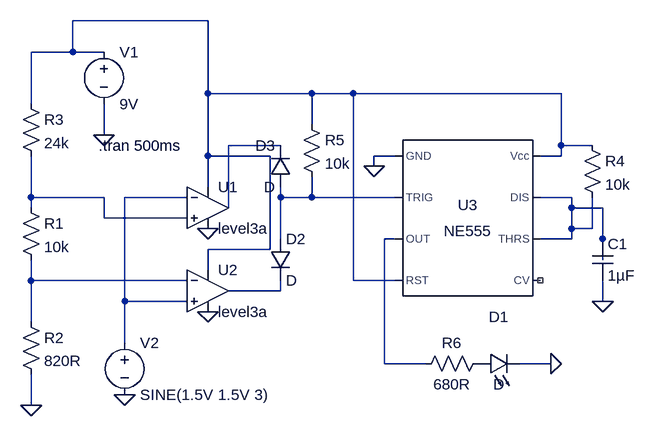
[diagram p0: schematic Draft3.asc]
Draft3.asc, the LTspice schematic file:
Version 4
SHEET 1 1012 680
WIRE 304 -16 96 -16
WIRE 96 32 96 -16
WIRE 96 32 32 32
WIRE 144 32 96 32
WIRE 304 96 304 -16
WIRE 464 96 304 96
WIRE 528 96 464 96
WIRE 848 96 528 96
WIRE 32 112 32 32
WIRE 464 144 464 96
WIRE 144 160 144 112
WIRE 416 176 336 176
WIRE 848 176 848 96
WIRE 896 176 848 176
WIRE 304 192 304 96
WIRE 400 192 304 192
WIRE 592 192 560 192
WIRE 848 192 848 176
WIRE 848 192 816 192
WIRE 560 208 560 192
WIRE 304 240 304 192
WIRE 32 256 32 192
WIRE 144 256 32 256
WIRE 272 256 176 256
WIRE 416 256 416 240
WIRE 464 256 464 224
WIRE 464 256 416 256
WIRE 592 256 464 256
WIRE 864 256 816 256
WIRE 32 272 32 256
WIRE 336 272 336 176
WIRE 864 272 864 256
WIRE 912 272 864 272
WIRE 144 288 144 256
WIRE 272 288 144 288
WIRE 864 304 864 272
WIRE 896 304 896 256
WIRE 896 304 864 304
WIRE 416 320 416 256
WIRE 592 320 576 320
WIRE 864 320 864 304
WIRE 864 320 816 320
WIRE 912 320 912 272
WIRE 400 336 400 192
WIRE 400 336 304 336
WIRE 912 352 912 320
WIRE 304 368 304 336
WIRE 32 384 32 352
WIRE 272 384 32 384
WIRE 528 384 528 96
WIRE 592 384 528 384
WIRE 416 400 416 384
WIRE 416 400 336 400
WIRE 176 416 176 256
WIRE 272 416 176 416
WIRE 912 416 912 384
WIRE 32 448 32 384
WIRE 176 480 176 416
WIRE 576 512 576 320
WIRE 640 512 576 512
WIRE 832 512 784 512
WIRE 32 576 32 528
FLAG 32 576 0
FLAG 144 160 0
FLAG 304 432 0
FLAG 304 304 0
FLAG 176 560 0
FLAG 560 208 0
FLAG 912 416 0
FLAG 832 512 0
SYMBOL Res 16 256 R0
SYMATTR InstName R1
SYMATTR Value 10k
SYMBOL Res 16 432 R0
SYMATTR InstName R2
SYMATTR Value 820R
SYMBOL Res 16 96 R0
SYMATTR InstName R3
SYMATTR Value 24k
SYMBOL Voltage 144 16 R0
SYMATTR InstName V1
SYMATTR Value 9V
SYMBOL OpAmps/UniversalOpAmp3 304 272 R0
SYMATTR InstName U1
SYMBOL OpAmps/UniversalOpAmp3 304 400 R0
SYMATTR InstName U2
SYMBOL Voltage 176 464 R0
WINDOW 123 0 0 Left 0
WINDOW 39 0 0 Left 0
SYMATTR InstName V2
SYMATTR Value SINE(1.5V 1.5V 3)
SYMBOL Misc/NE555 704 288 R0
SYMATTR InstName U3
SYMBOL res 880 160 R0
SYMATTR InstName R4
SYMATTR Value 10k
SYMBOL cap 896 320 R0
SYMATTR InstName C1
SYMATTR Value 1µF
SYMBOL res 448 128 R0
SYMATTR InstName R5
SYMATTR Value 10k
SYMBOL res 736 496 R90
WINDOW 0 0 56 VBottom 2
WINDOW 3 32 56 VTop 2
SYMATTR InstName R6
SYMATTR Value 680R
SYMBOL LED 720 528 R270
WINDOW 0 72 32 VTop 2
WINDOW 3 0 32 VBottom 2
SYMATTR InstName D1
SYMBOL diode 400 320 R0
SYMATTR InstName D2
SYMBOL diode 432 240 R180
WINDOW 0 24 64 Left 2
WINDOW 3 24 0 Left 2
SYMATTR InstName D3
TEXT 136 176 Left 2 !.tran 500ms

The netlist it stands for:
* Draft3.asc
R1 N003 N008 10k
R2 N008 0 820R
R3 N001 N003 24k
V1 N001 0 9V
XU1 N003 N004 N001 0 N002 level3a  ; pins In+ In- V+ V- OUT
XU2 N004 N008 N001 0 N009 level3a  ; pins In+ In- V+ V- OUT
V2 N004 0 SINE(1.5V 1.5V 3)
XU3 0 N005 N007 N001 NC_01 N006 N006 N001 NE555  ; pins GND TRIG OUT RST CV THRS DIS Vcc
R4 N001 N006 10k
C1 N006 0 1µF
R5 N001 N005 10k
R6 P001 N007 680R
D1 P001 0 D
D2 N005 N009 D
D3 N005 N002 D
.model D D
.lib standard.dio
.tran 500ms
.lib NE555.sub
.backanno
.end